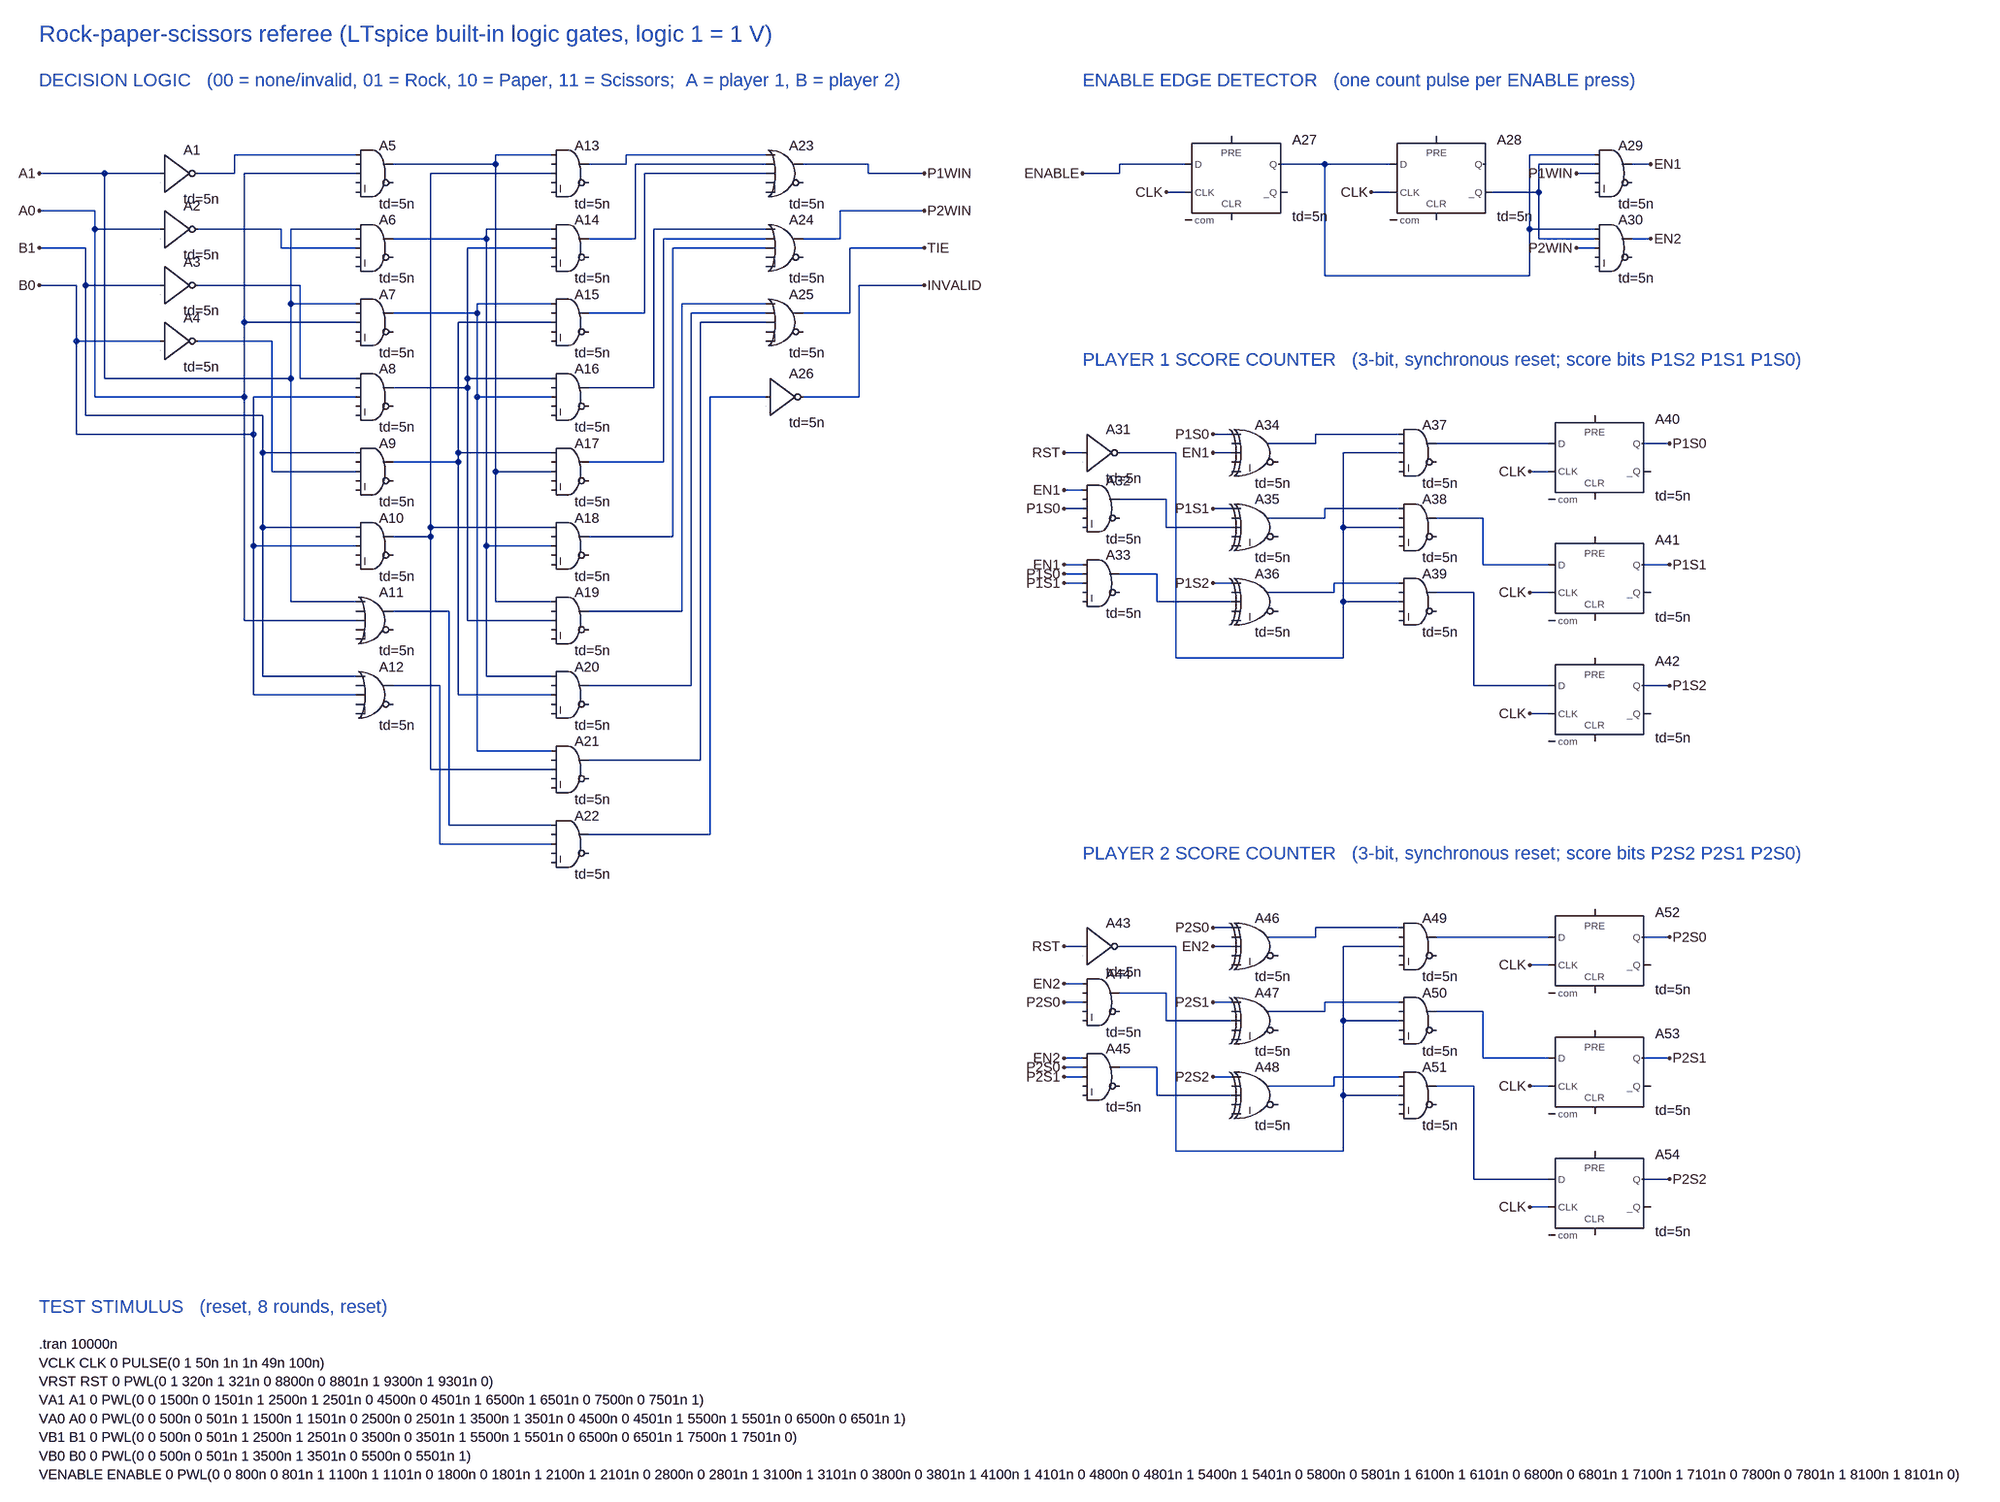
[diagram p0: schematic rock_paper_scissors.asc]
rock_paper_scissors.asc, the LTspice schematic file:
Version 4.1
SHEET 1 3952 3064
WIRE 704 256 496 256
WIRE 1040 256 944 256
WIRE 1408 256 1168 256
WIRE 2832 256 2720 256
WIRE 944 272 944 256
WIRE 944 272 768 272
WIRE 1168 272 1168 256
WIRE 1168 272 1104 272
WIRE 1408 272 1184 272
WIRE 1584 272 1472 272
WIRE 2128 272 2016 272
WIRE 2368 272 2288 272
WIRE 2480 272 2368 272
WIRE 2832 272 2736 272
WIRE 2928 272 2896 272
WIRE 272 288 160 288
WIRE 368 288 272 288
WIRE 496 288 496 256
WIRE 496 288 432 288
WIRE 704 288 512 288
WIRE 1040 288 832 288
WIRE 1408 288 1200 288
WIRE 1584 288 1584 272
WIRE 1680 288 1584 288
WIRE 2016 288 2016 272
WIRE 2016 288 1952 288
WIRE 2832 288 2800 288
WIRE 2128 320 2096 320
WIRE 2480 320 2448 320
WIRE 2736 320 2736 272
WIRE 2736 320 2656 320
WIRE 256 352 160 352
WIRE 1680 352 1536 352
WIRE 256 384 256 352
WIRE 368 384 256 384
WIRE 576 384 432 384
WIRE 704 384 592 384
WIRE 1040 384 928 384
WIRE 1408 384 1216 384
WIRE 2720 384 2720 256
WIRE 2832 384 2720 384
WIRE 928 400 928 384
WIRE 928 400 768 400
WIRE 1184 400 1184 272
WIRE 1184 400 1104 400
WIRE 1408 400 1232 400
WIRE 1536 400 1536 352
WIRE 1536 400 1472 400
WIRE 2736 400 2736 320
WIRE 2832 400 2736 400
WIRE 2928 400 2896 400
WIRE 240 416 160 416
WIRE 576 416 576 384
WIRE 704 416 576 416
WIRE 1040 416 896 416
WIRE 1408 416 1248 416
WIRE 1680 416 1552 416
WIRE 2832 416 2800 416
WIRE 2368 464 2368 272
WIRE 2720 464 2720 384
WIRE 2720 464 2368 464
WIRE 224 480 160 480
WIRE 240 480 240 416
WIRE 368 480 240 480
WIRE 608 480 432 480
WIRE 1680 480 1568 480
WIRE 592 512 592 384
WIRE 704 512 592 512
WIRE 1040 512 912 512
WIRE 1408 512 1264 512
WIRE 912 528 912 512
WIRE 912 528 768 528
WIRE 1200 528 1200 288
WIRE 1200 528 1104 528
WIRE 1408 528 1280 528
WIRE 1552 528 1552 416
WIRE 1552 528 1472 528
WIRE 512 544 512 288
WIRE 704 544 512 544
WIRE 1040 544 880 544
WIRE 1408 544 1296 544
WIRE 224 576 224 480
WIRE 368 576 224 576
WIRE 560 576 432 576
WIRE 272 640 272 288
WIRE 592 640 592 512
WIRE 592 640 272 640
WIRE 608 640 608 480
WIRE 704 640 608 640
WIRE 896 640 896 416
WIRE 1040 640 896 640
WIRE 896 656 896 640
WIRE 896 656 768 656
WIRE 1216 656 1216 384
WIRE 1216 656 1104 656
WIRE 256 672 256 384
WIRE 512 672 512 544
WIRE 512 672 256 672
WIRE 704 672 528 672
WIRE 912 672 912 528
WIRE 1040 672 912 672
WIRE 1408 672 1312 672
WIRE 1568 672 1568 480
WIRE 1568 672 1472 672
WIRE 240 704 240 480
WIRE 544 704 240 704
WIRE 224 736 224 576
WIRE 528 736 528 672
WIRE 528 736 224 736
WIRE 2208 736 2176 736
WIRE 2496 736 2352 736
WIRE 2352 752 2352 736
WIRE 2352 752 2272 752
WIRE 2752 752 2560 752
WIRE 2960 752 2912 752
WIRE 544 768 544 704
WIRE 704 768 544 768
WIRE 880 768 880 544
WIRE 1040 768 880 768
WIRE 1952 768 1920 768
WIRE 2112 768 2016 768
WIRE 2208 768 2176 768
WIRE 2496 768 2400 768
WIRE 880 784 880 768
WIRE 880 784 768 784
WIRE 1232 784 1232 400
WIRE 1232 784 1104 784
WIRE 560 800 560 576
WIRE 704 800 560 800
WIRE 944 800 944 272
WIRE 1040 800 944 800
WIRE 2752 800 2720 800
WIRE 1952 832 1920 832
WIRE 2096 848 2016 848
WIRE 1952 864 1920 864
WIRE 2208 864 2176 864
WIRE 2496 864 2368 864
WIRE 2368 880 2368 864
WIRE 2368 880 2272 880
WIRE 2640 880 2560 880
WIRE 544 896 544 768
WIRE 704 896 544 896
WIRE 832 896 832 288
WIRE 1040 896 832 896
WIRE 2096 896 2096 848
WIRE 2208 896 2096 896
WIRE 2400 896 2400 768
WIRE 2496 896 2400 896
WIRE 832 912 832 896
WIRE 832 912 768 912
WIRE 1248 912 1248 416
WIRE 1248 912 1104 912
WIRE 528 928 528 736
WIRE 704 928 528 928
WIRE 928 928 928 400
WIRE 1040 928 928 928
WIRE 1952 960 1920 960
WIRE 2640 960 2640 880
WIRE 2752 960 2640 960
WIRE 2960 960 2912 960
WIRE 1952 976 1920 976
WIRE 2080 976 2016 976
WIRE 1952 992 1920 992
WIRE 2208 992 2176 992
WIRE 2496 992 2384 992
WIRE 2384 1008 2384 992
WIRE 2384 1008 2272 1008
WIRE 2624 1008 2560 1008
WIRE 2752 1008 2720 1008
WIRE 592 1024 592 640
WIRE 704 1024 592 1024
WIRE 944 1024 944 800
WIRE 1040 1024 944 1024
WIRE 2080 1024 2080 976
WIRE 2208 1024 2080 1024
WIRE 2400 1024 2400 896
WIRE 2496 1024 2400 1024
WIRE 864 1040 768 1040
WIRE 1264 1040 1264 512
WIRE 1264 1040 1104 1040
WIRE 512 1056 512 672
WIRE 704 1056 512 1056
WIRE 896 1056 896 656
WIRE 1040 1056 896 1056
WIRE 2112 1120 2112 768
WIRE 2400 1120 2400 1024
WIRE 2400 1120 2112 1120
WIRE 544 1152 544 896
WIRE 704 1152 544 1152
WIRE 928 1152 928 928
WIRE 1040 1152 928 1152
WIRE 848 1168 768 1168
WIRE 1280 1168 1280 528
WIRE 1280 1168 1104 1168
WIRE 2624 1168 2624 1008
WIRE 2752 1168 2624 1168
WIRE 2960 1168 2912 1168
WIRE 528 1184 528 928
WIRE 704 1184 528 1184
WIRE 880 1184 880 784
WIRE 1040 1184 880 1184
WIRE 2752 1216 2720 1216
WIRE 912 1280 912 672
WIRE 1040 1280 912 1280
WIRE 1296 1296 1296 544
WIRE 1296 1296 1104 1296
WIRE 832 1312 832 912
WIRE 1040 1312 832 1312
WIRE 864 1408 864 1040
WIRE 1040 1408 864 1408
WIRE 1312 1424 1312 672
WIRE 1312 1424 1104 1424
WIRE 848 1440 848 1168
WIRE 1040 1440 848 1440
WIRE 2208 1584 2176 1584
WIRE 2496 1584 2352 1584
WIRE 2352 1600 2352 1584
WIRE 2352 1600 2272 1600
WIRE 2752 1600 2560 1600
WIRE 2960 1600 2912 1600
WIRE 1952 1616 1920 1616
WIRE 2112 1616 2016 1616
WIRE 2208 1616 2176 1616
WIRE 2496 1616 2400 1616
WIRE 2752 1648 2720 1648
WIRE 1952 1680 1920 1680
WIRE 2096 1696 2016 1696
WIRE 1952 1712 1920 1712
WIRE 2208 1712 2176 1712
WIRE 2496 1712 2368 1712
WIRE 2368 1728 2368 1712
WIRE 2368 1728 2272 1728
WIRE 2640 1728 2560 1728
WIRE 2096 1744 2096 1696
WIRE 2208 1744 2096 1744
WIRE 2400 1744 2400 1616
WIRE 2496 1744 2400 1744
WIRE 1952 1808 1920 1808
WIRE 2640 1808 2640 1728
WIRE 2752 1808 2640 1808
WIRE 2960 1808 2912 1808
WIRE 1952 1824 1920 1824
WIRE 2080 1824 2016 1824
WIRE 1952 1840 1920 1840
WIRE 2208 1840 2176 1840
WIRE 2496 1840 2384 1840
WIRE 2384 1856 2384 1840
WIRE 2384 1856 2272 1856
WIRE 2624 1856 2560 1856
WIRE 2752 1856 2720 1856
WIRE 2080 1872 2080 1824
WIRE 2208 1872 2080 1872
WIRE 2400 1872 2400 1744
WIRE 2496 1872 2400 1872
WIRE 2112 1968 2112 1616
WIRE 2400 1968 2400 1872
WIRE 2400 1968 2112 1968
WIRE 2624 2016 2624 1856
WIRE 2752 2016 2624 2016
WIRE 2960 2016 2912 2016
WIRE 2752 2064 2720 2064
FLAG 160 288 A1
FLAG 160 352 A0
FLAG 160 416 B1
FLAG 160 480 B0
FLAG 1680 288 P1WIN
FLAG 1680 352 P2WIN
FLAG 1680 416 TIE
FLAG 1680 480 INVALID
FLAG 1952 288 ENABLE
FLAG 2096 320 CLK
FLAG 2448 320 CLK
FLAG 2800 288 P1WIN
FLAG 2928 272 EN1
FLAG 2800 416 P2WIN
FLAG 2928 400 EN2
FLAG 1920 768 RST
FLAG 1920 832 EN1
FLAG 1920 864 P1S0
FLAG 1920 960 EN1
FLAG 1920 976 P1S0
FLAG 1920 992 P1S1
FLAG 2176 736 P1S0
FLAG 2176 768 EN1
FLAG 2176 864 P1S1
FLAG 2176 992 P1S2
FLAG 2720 800 CLK
FLAG 2960 752 P1S0
FLAG 2720 1008 CLK
FLAG 2960 960 P1S1
FLAG 2720 1216 CLK
FLAG 2960 1168 P1S2
FLAG 1920 1616 RST
FLAG 1920 1680 EN2
FLAG 1920 1712 P2S0
FLAG 1920 1808 EN2
FLAG 1920 1824 P2S0
FLAG 1920 1840 P2S1
FLAG 2176 1584 P2S0
FLAG 2176 1616 EN2
FLAG 2176 1712 P2S1
FLAG 2176 1840 P2S2
FLAG 2720 1648 CLK
FLAG 2960 1600 P2S0
FLAG 2720 1856 CLK
FLAG 2960 1808 P2S1
FLAG 2720 2064 CLK
FLAG 2960 2016 P2S2
SYMBOL Digital\\inv 368 224 R0
SYMATTR InstName A1
SYMATTR Value td=5n
SYMBOL Digital\\inv 368 320 R0
SYMATTR InstName A2
SYMATTR Value td=5n
SYMBOL Digital\\inv 368 416 R0
SYMATTR InstName A3
SYMATTR Value td=5n
SYMBOL Digital\\inv 368 512 R0
SYMATTR InstName A4
SYMATTR Value td=5n
SYMBOL Digital\\and 736 224 R0
SYMATTR InstName A5
SYMATTR Value td=5n
SYMBOL Digital\\and 736 352 R0
SYMATTR InstName A6
SYMATTR Value td=5n
SYMBOL Digital\\and 736 480 R0
SYMATTR InstName A7
SYMATTR Value td=5n
SYMBOL Digital\\and 736 608 R0
SYMATTR InstName A8
SYMATTR Value td=5n
SYMBOL Digital\\and 736 736 R0
SYMATTR InstName A9
SYMATTR Value td=5n
SYMBOL Digital\\and 736 864 R0
SYMATTR InstName A10
SYMATTR Value td=5n
SYMBOL Digital\\or 736 992 R0
SYMATTR InstName A11
SYMATTR Value td=5n
SYMBOL Digital\\or 736 1120 R0
SYMATTR InstName A12
SYMATTR Value td=5n
SYMBOL Digital\\and 1072 224 R0
SYMATTR InstName A13
SYMATTR Value td=5n
SYMBOL Digital\\and 1072 352 R0
SYMATTR InstName A14
SYMATTR Value td=5n
SYMBOL Digital\\and 1072 480 R0
SYMATTR InstName A15
SYMATTR Value td=5n
SYMBOL Digital\\and 1072 608 R0
SYMATTR InstName A16
SYMATTR Value td=5n
SYMBOL Digital\\and 1072 736 R0
SYMATTR InstName A17
SYMATTR Value td=5n
SYMBOL Digital\\and 1072 864 R0
SYMATTR InstName A18
SYMATTR Value td=5n
SYMBOL Digital\\and 1072 992 R0
SYMATTR InstName A19
SYMATTR Value td=5n
SYMBOL Digital\\and 1072 1120 R0
SYMATTR InstName A20
SYMATTR Value td=5n
SYMBOL Digital\\and 1072 1248 R0
SYMATTR InstName A21
SYMATTR Value td=5n
SYMBOL Digital\\and 1072 1376 R0
SYMATTR InstName A22
SYMATTR Value td=5n
SYMBOL Digital\\or 1440 224 R0
SYMATTR InstName A23
SYMATTR Value td=5n
SYMBOL Digital\\or 1440 352 R0
SYMATTR InstName A24
SYMATTR Value td=5n
SYMBOL Digital\\or 1440 480 R0
SYMATTR InstName A25
SYMATTR Value td=5n
SYMBOL Digital\\inv 1408 608 R0
SYMATTR InstName A26
SYMATTR Value td=5n
SYMBOL Digital\\dflop 2208 224 R0
SYMATTR InstName A27
SYMATTR Value td=5n
SYMBOL Digital\\dflop 2560 224 R0
SYMATTR InstName A28
SYMATTR Value td=5n
SYMBOL Digital\\and 2864 224 R0
SYMATTR InstName A29
SYMATTR Value td=5n
SYMBOL Digital\\and 2864 352 R0
SYMATTR InstName A30
SYMATTR Value td=5n
SYMBOL Digital\\inv 1952 704 R0
SYMATTR InstName A31
SYMATTR Value td=5n
SYMBOL Digital\\and 1984 800 R0
SYMATTR InstName A32
SYMATTR Value td=5n
SYMBOL Digital\\and 1984 928 R0
SYMATTR InstName A33
SYMATTR Value td=5n
SYMBOL Digital\\xor 2256 704 R0
SYMATTR InstName A34
SYMATTR Value td=5n
SYMBOL Digital\\xor 2256 832 R0
SYMATTR InstName A35
SYMATTR Value td=5n
SYMBOL Digital\\xor 2256 960 R0
SYMATTR InstName A36
SYMATTR Value td=5n
SYMBOL Digital\\and 2528 704 R0
SYMATTR InstName A37
SYMATTR Value td=5n
SYMBOL Digital\\and 2528 832 R0
SYMATTR InstName A38
SYMATTR Value td=5n
SYMBOL Digital\\and 2528 960 R0
SYMATTR InstName A39
SYMATTR Value td=5n
SYMBOL Digital\\dflop 2832 704 R0
SYMATTR InstName A40
SYMATTR Value td=5n
SYMBOL Digital\\dflop 2832 912 R0
SYMATTR InstName A41
SYMATTR Value td=5n
SYMBOL Digital\\dflop 2832 1120 R0
SYMATTR InstName A42
SYMATTR Value td=5n
SYMBOL Digital\\inv 1952 1552 R0
SYMATTR InstName A43
SYMATTR Value td=5n
SYMBOL Digital\\and 1984 1648 R0
SYMATTR InstName A44
SYMATTR Value td=5n
SYMBOL Digital\\and 1984 1776 R0
SYMATTR InstName A45
SYMATTR Value td=5n
SYMBOL Digital\\xor 2256 1552 R0
SYMATTR InstName A46
SYMATTR Value td=5n
SYMBOL Digital\\xor 2256 1680 R0
SYMATTR InstName A47
SYMATTR Value td=5n
SYMBOL Digital\\xor 2256 1808 R0
SYMATTR InstName A48
SYMATTR Value td=5n
SYMBOL Digital\\and 2528 1552 R0
SYMATTR InstName A49
SYMATTR Value td=5n
SYMBOL Digital\\and 2528 1680 R0
SYMATTR InstName A50
SYMATTR Value td=5n
SYMBOL Digital\\and 2528 1808 R0
SYMATTR InstName A51
SYMATTR Value td=5n
SYMBOL Digital\\dflop 2832 1552 R0
SYMATTR InstName A52
SYMATTR Value td=5n
SYMBOL Digital\\dflop 2832 1760 R0
SYMATTR InstName A53
SYMATTR Value td=5n
SYMBOL Digital\\dflop 2832 1968 R0
SYMATTR InstName A54
SYMATTR Value td=5n
TEXT 160 48 Left 4 ;Rock-paper-scissors referee (LTspice built-in logic gates, logic 1 = 1 V)
TEXT 160 128 Left 3 ;DECISION LOGIC   (00 = none/invalid, 01 = Rock, 10 = Paper, 11 = Scissors;  A = player 1, B = player 2)
TEXT 1952 128 Left 3 ;ENABLE EDGE DETECTOR   (one count pulse per ENABLE press)
TEXT 1952 608 Left 3 ;PLAYER 1 SCORE COUNTER   (3-bit, synchronous reset; score bits P1S2 P1S1 P1S0)
TEXT 1952 1456 Left 3 ;PLAYER 2 SCORE COUNTER   (3-bit, synchronous reset; score bits P2S2 P2S1 P2S0)
TEXT 160 2464 Left 3 ;TEST STIMULUS   (reset, 8 rounds, reset)
TEXT 160 2528 Left 2 !.tran 10000n
TEXT 160 2560 Left 2 !VCLK CLK 0 PULSE(0 1 50n 1n 1n 49n 100n)
TEXT 160 2592 Left 2 !VRST RST 0 PWL(0 1 320n 1 321n 0 8800n 0 8801n 1 9300n 1 9301n 0)
TEXT 160 2624 Left 2 !VA1 A1 0 PWL(0 0 1500n 0 1501n 1 2500n 1 2501n 0 4500n 0 4501n 1 6500n 1 6501n 0 7500n 0 7501n 1)
TEXT 160 2656 Left 2 !VA0 A0 0 PWL(0 0 500n 0 501n 1 1500n 1 1501n 0 2500n 0 2501n 1 3500n 1 3501n 0 4500n 0 4501n 1 5500n 1 5501n 0 6500n 0 6501n 1)
TEXT 160 2688 Left 2 !VB1 B1 0 PWL(0 0 500n 0 501n 1 2500n 1 2501n 0 3500n 0 3501n 1 5500n 1 5501n 0 6500n 0 6501n 1 7500n 1 7501n 0)
TEXT 160 2720 Left 2 !VB0 B0 0 PWL(0 0 500n 0 501n 1 3500n 1 3501n 0 5500n 0 5501n 1)
TEXT 160 2752 Left 2 !VENABLE ENABLE 0 PWL(0 0 800n 0 801n 1 1100n 1 1101n 0 1800n 0 1801n 1 2100n 1 2101n 0 2800n 0 2801n 1 3100n 1 3101n 0 3800n 0 3801n 1 4100n 1 4101n 0 4800n 0 4801n 1 5400n 1 5401n 0 5800n 0 5801n 1 6100n 1 6101n 0 6800n 0 6801n 1 7100n 1 7101n 0 7800n 0 7801n 1 8100n 1 8101n 0)

The netlist it stands for:
* rock_paper_scissors.asc
A1 A1 0 0 0 0 N001 0 0 BUF td=5n
A2 A0 0 0 0 0 N009 0 0 BUF td=5n
A3 B1 0 0 0 0 N015 0 0 BUF td=5n
A4 B0 0 0 0 0 N021 0 0 BUF td=5n
A5 N001 0 A0 0 0 0 N002 0 AND td=5n
A6 A1 0 N009 0 0 0 N010 0 AND td=5n
A7 A1 0 A0 0 0 0 N016 0 AND td=5n
A8 N015 0 B0 0 0 0 N013 0 AND td=5n
A9 B1 0 N021 0 0 0 N019 0 AND td=5n
A10 B1 0 B0 0 0 0 N007 0 AND td=5n
A11 A1 0 A0 0 0 0 N032 0 OR td=5n
A12 B1 0 B0 0 0 0 N033 0 OR td=5n
A13 N002 0 N007 0 0 0 N003 0 AND td=5n
A14 N010 0 N013 0 0 0 N005 0 AND td=5n
A15 N016 0 N019 0 0 0 N008 0 AND td=5n
A16 N013 0 N016 0 0 0 N011 0 AND td=5n
A17 N019 0 N002 0 0 0 N012 0 AND td=5n
A18 N007 0 N010 0 0 0 N014 0 AND td=5n
A19 N002 0 N013 0 0 0 N017 0 AND td=5n
A20 N010 0 N019 0 0 0 N018 0 AND td=5n
A21 N016 0 N007 0 0 0 N020 0 AND td=5n
A22 N032 0 N033 0 0 0 N022 0 AND td=5n
A23 N003 N005 N008 0 0 0 P1WIN 0 OR td=5n
A24 N011 N012 N014 0 0 0 P2WIN 0 OR td=5n
A25 N017 N018 N020 0 0 0 TIE 0 OR td=5n
A26 N022 0 0 0 0 INVALID 0 0 BUF td=5n
A27 ENABLE 0 CLK 0 0 0 N004 0 DFLOP td=5n
A28 N004 0 CLK 0 0 N006 0 0 DFLOP td=5n
A29 N004 N006 P1WIN 0 0 0 EN1 0 AND td=5n
A30 N004 N006 P2WIN 0 0 0 EN2 0 AND td=5n
A31 RST 0 0 0 0 N025 0 0 BUF td=5n
A32 EN1 0 P1S0 0 0 0 N026 0 AND td=5n
A33 EN1 P1S0 P1S1 0 0 0 N029 0 AND td=5n
A34 P1S0 0 EN1 0 0 0 N023 0 XOR td=5n
A35 P1S1 0 N026 0 0 0 N027 0 XOR td=5n
A36 P1S2 0 N029 0 0 0 N030 0 XOR td=5n
A37 N023 0 N025 0 0 0 N024 0 AND td=5n
A38 N027 0 N025 0 0 0 N028 0 AND td=5n
A39 N030 0 N025 0 0 0 N031 0 AND td=5n
A40 N024 0 CLK 0 0 0 P1S0 0 DFLOP td=5n
A41 N028 0 CLK 0 0 0 P1S1 0 DFLOP td=5n
A42 N031 0 CLK 0 0 0 P1S2 0 DFLOP td=5n
A43 RST 0 0 0 0 N036 0 0 BUF td=5n
A44 EN2 0 P2S0 0 0 0 N037 0 AND td=5n
A45 EN2 P2S0 P2S1 0 0 0 N040 0 AND td=5n
A46 P2S0 0 EN2 0 0 0 N034 0 XOR td=5n
A47 P2S1 0 N037 0 0 0 N038 0 XOR td=5n
A48 P2S2 0 N040 0 0 0 N041 0 XOR td=5n
A49 N034 0 N036 0 0 0 N035 0 AND td=5n
A50 N038 0 N036 0 0 0 N039 0 AND td=5n
A51 N041 0 N036 0 0 0 N042 0 AND td=5n
A52 N035 0 CLK 0 0 0 P2S0 0 DFLOP td=5n
A53 N039 0 CLK 0 0 0 P2S1 0 DFLOP td=5n
A54 N042 0 CLK 0 0 0 P2S2 0 DFLOP td=5n
* Rock-paper-scissors referee (LTspice built-in logic gates, logic 1 = 1 V)
* DECISION LOGIC   (00 = none/invalid, 01 = Rock, 10 = Paper, 11 = Scissors;  A = player 1, B = player 2)
* ENABLE EDGE DETECTOR   (one count pulse per ENABLE press)
* PLAYER 1 SCORE COUNTER   (3-bit, synchronous reset; score bits P1S2 P1S1 P1S0)
* PLAYER 2 SCORE COUNTER   (3-bit, synchronous reset; score bits P2S2 P2S1 P2S0)
* TEST STIMULUS   (reset, 8 rounds, reset)
.tran 10000n
VCLK CLK 0 PULSE(0 1 50n 1n 1n 49n 100n)
VRST RST 0 PWL(0 1 320n 1 321n 0 8800n 0 8801n 1 9300n 1 9301n 0)
VA1 A1 0 PWL(0 0 1500n 0 1501n 1 2500n 1 2501n 0 4500n 0 4501n 1 6500n 1 6501n 0 7500n 0 7501n 1)
VA0 A0 0 PWL(0 0 500n 0 501n 1 1500n 1 1501n 0 2500n 0 2501n 1 3500n 1 3501n 0 4500n 0 4501n 1 5500n 1 5501n 0 6500n 0 6501n 1)
VB1 B1 0 PWL(0 0 500n 0 501n 1 2500n 1 2501n 0 3500n 0 3501n 1 5500n 1 5501n 0 6500n 0 6501n 1 7500n 1 7501n 0)
VB0 B0 0 PWL(0 0 500n 0 501n 1 3500n 1 3501n 0 5500n 0 5501n 1)
VENABLE ENABLE 0 PWL(0 0 800n 0 801n 1 1100n 1 1101n 0 1800n 0 1801n 1 2100n 1 2101n 0 2800n 0 2801n 1 3100n 1 3101n 0 3800n 0 3801n 1 4100n 1 4101n 0 4800n 0 4801n 1 5400n 1 5401n 0 5800n 0 5801n 1 6100n 1 6101n 0 6800n 0 6801n 1 7100n 1 7101n 0 7800n 0 7801n 1 8100n 1 8101n 0)
.backanno
.end